# Altium project Spider Drone.PrjPcb
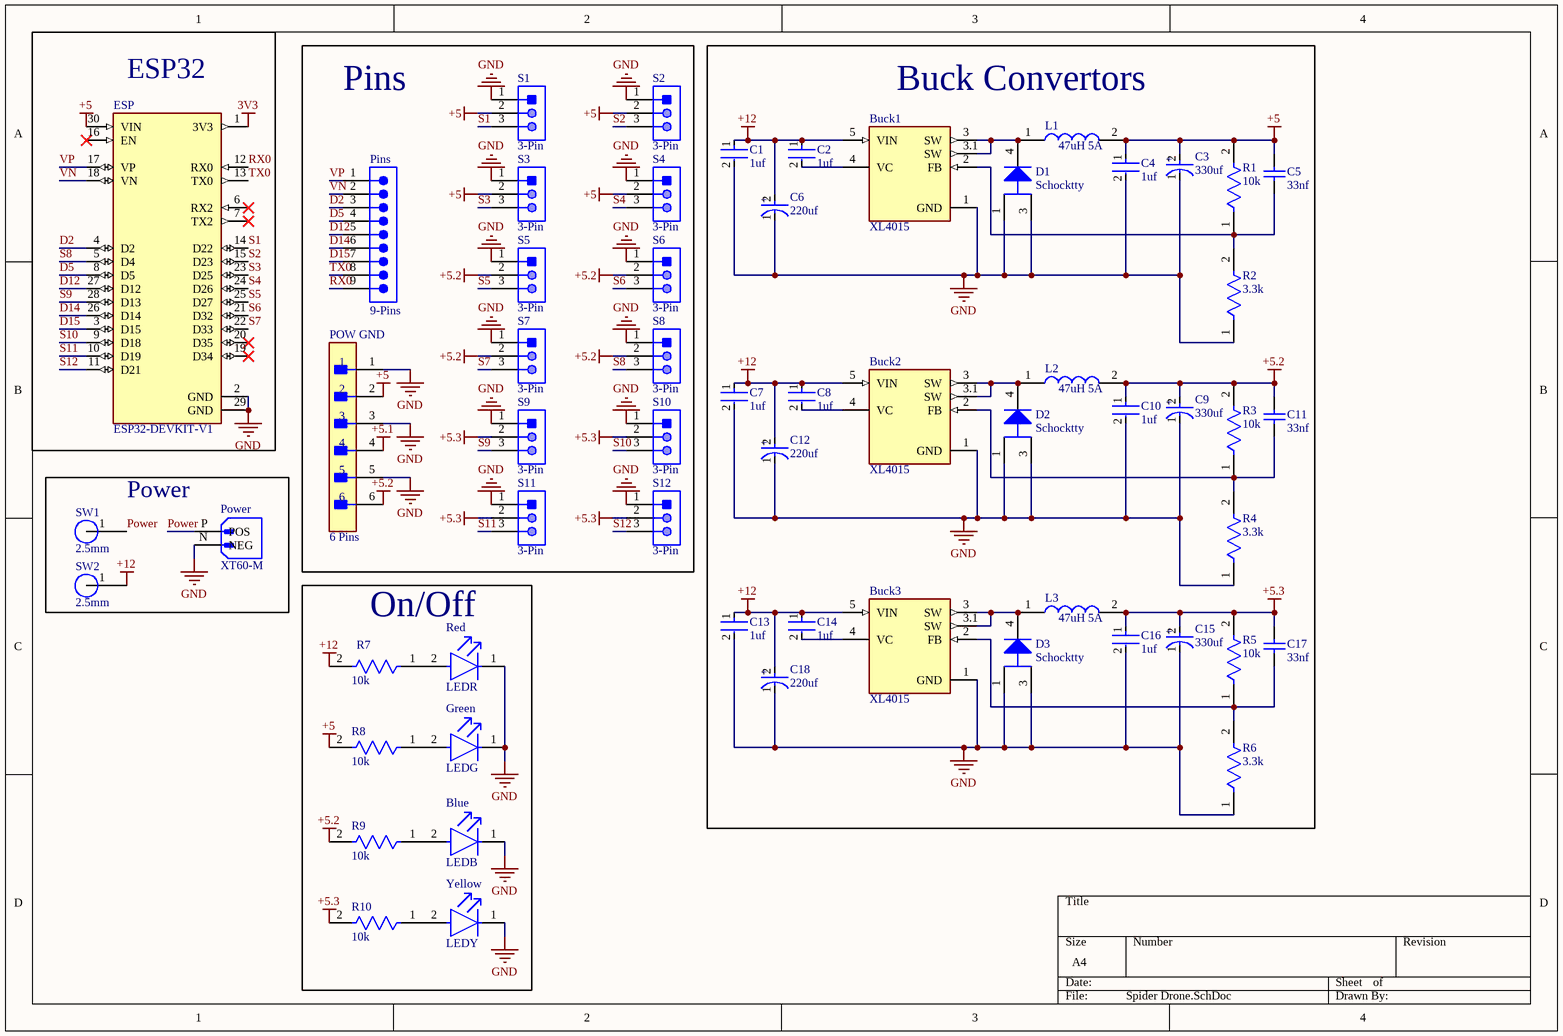
[diagram p0: Spider Drone.SchDoc]
1 sheet, 59 parts. Net scope: global (net labels, ports and power ports of the same name join across sheets).
Board file: Spider Drone.PcbDoc

## Sheet Spider Drone.SchDoc
size A4; SheetNumber: 1; SheetTotal: 1

### Parts
Blue  LEDB  [FP-APHCM2012QBC-D-F01-MFG]
Buck1  XL4015  [CONV_XL4015]
Buck2  XL4015  [CONV_XL4015]
Buck3  XL4015  [CONV_XL4015]
C1  1uf  [FP-CC0603-DA-MFG]
C2  1uf  [FP-CC0603-DA-MFG]
C3  330uf  [FP-EEH-G12-MFG]
C4  1uf  [FP-CC0603-DA-MFG]
C5  33nf  [CAPC1608X92X38LL15T08]
C6  220uf  [FP-EEH-F-MFG]
C7  1uf  [FP-CC0603-DA-MFG]
C8  1uf  [FP-CC0603-DA-MFG]
C9  330uf  [FP-EEH-G12-MFG]
C10  1uf  [FP-CC0603-DA-MFG]
C11  33nf  [CAPC1608X92X38LL15T08]
C12  220uf  [FP-EEH-F-MFG]
C13  1uf  [FP-CC0603-DA-MFG]
C14  1uf  [FP-CC0603-DA-MFG]
C15  330uf  [FP-EEH-G12-MFG]
C16  1uf  [FP-CC0603-DA-MFG]
C17  33nf  [CAPC1608X92X38LL15T08]
C18  220uf  [FP-EEH-F-MFG]
D1  Schocktty  [ONSC-DPAK-3-369C-01_V]
D2  Schocktty  [ONSC-DPAK-3-369C-01_V]
D3  Schocktty  [ONSC-DPAK-3-369C-01_V]
ESP  ESP32-DEVKIT-V1  [MODULE_ESP32_DEVKIT_V1]
Green  LEDG  [FP-APHD1608LZGCK-MFG]
L1  47uH 5A  [PM4343473NLT]
L2  47uH 5A  [PM4343473NLT]
L3  47uH 5A  [PM4343473NLT]
Pins  9-Pins  [61300911121]
POW_GND  6 Pins  [FP-22-28-4063-MFG]
Power  XT60-M  [AMASS_XT60-M]
R1  10k  [FP-CRGCQ0603-IPC_C]
R2  3.3k  [FP-AC0603-IPC_C]
R3  10k  [FP-CRGCQ0603-IPC_C]
R4  3.3k  [FP-AC0603-IPC_C]
R5  10k  [FP-CRGCQ0603-IPC_C]
R6  3.3k  [FP-AC0603-IPC_C]
R7  10k  [FP-CRGCQ0603-IPC_C]
R8  10k  [FP-CRGCQ0603-IPC_C]
R9  10k  [FP-CRGCQ0603-IPC_C]
R10  10k  [FP-CRGCQ0603-IPC_C]
Red  LEDR  [FP-LTST-C191KRKT-MFG]
S1  3-Pin  [MOLX-22-28-4033_V]
S2  3-Pin  [MOLX-22-28-4033_V]
S3  3-Pin  [MOLX-22-28-4033_V]
S4  3-Pin  [MOLX-22-28-4033_V]
S5  3-Pin  [MOLX-22-28-4033_V]
S6  3-Pin  [MOLX-22-28-4033_V]
S7  3-Pin  [MOLX-22-28-4033_V]
S8  3-Pin  [MOLX-22-28-4033_V]
S9  3-Pin  [MOLX-22-28-4033_V]
S10  3-Pin  [MOLX-22-28-4033_V]
S11  3-Pin  [MOLX-22-28-4033_V]
S12  3-Pin  [MOLX-22-28-4033_V]
SW1  2.5mm  [PCBComponent_1]
SW2  2.5mm  [PCBComponent_1]
Yellow  LEDY  [FP-SML-D12-MFG]

### Blocks framed on the sheet
ESP32: ESP
Pins: Pins POW_GND S1-S12
Buck Convertors: Buck1-Buck3 C1-C18 D1-D3 L1-L3 R1-R6
Power: Power SW1 SW2
On/Off: Blue Green R7-R10 Red Yellow

### Nets
3V3: ESP.1(3V3)
+5: C3.2(A) C4.1 C5.2 ESP.30(VIN) L1.2 POW_GND.2 R1.2 R8.2 S1.2 S2.2 S3.2 S4.2
+5.1: POW_GND.4
+5.2: C9.2(A) C10.1 C11.2 L2.2 POW_GND.6 R3.2 R9.2 S5.2 S6.2 S7.2 S8.2
+5.3: C15.2(A) C16.1 C17.2 L3.2 R5.2 R10.2 S9.2 S10.2 S11.2 S12.2
+12: Buck1.5(VIN) Buck2.5(VIN) Buck3.5(VIN) C1.1 C2.1 C6.2(A) C7.1 C8.1 C12.2(A) C13.1 C14.1 C18.2(A) R7.2 SW2.1
GND: Blue.1(C) Buck1.1(GND) Buck2.1(GND) Buck3.1(GND) C1.2 C3.1(C) C4.2 C6.1(C) C7.2 C9.1(C) C10.2 C12.1(C) C13.2 C15.1(C) C16.2 C18.1(C) D1.1(A) D1.3(A) D2.1(A) D2.3(A) D3.1(A) D3.3(A) ESP.2(GND) ESP.29(GND) Green.1(C) POW_GND.1 POW_GND.3 POW_GND.5 Power.N(NEG) R2.1 R4.1 R6.1 Red.1(C) S1.1 S2.1 S3.1 S4.1 S5.1 S6.1 S7.1 S8.1 S9.1 S10.1 S11.1 S12.1 Yellow.1(C)
D2: ESP.4(D2) Pins.3
D5: ESP.8(D5) Pins.4
D12: ESP.27(D12) Pins.5
D14: ESP.26(D14) Pins.6
D15: ESP.3(D15) Pins.7
Power: Power.P(POS) SW1.1
RX0: ESP.12(RX0) Pins.9
S1: ESP.14(D22) S1.3
S2: ESP.15(D23) S2.3
S3: ESP.23(D25) S3.3
S4: ESP.24(D26) S4.3
S5: ESP.25(D27) S5.3
S6: ESP.21(D32) S6.3
S7: ESP.22(D33) S7.3
S8: ESP.5(D4) S8.3
S9: ESP.28(D13) S9.3
S10: ESP.9(D18) S10.3
S11: ESP.10(D19) S11.3
S12: ESP.11(D21) S12.3
TX0: ESP.13(TX0) Pins.8
VN: ESP.18(VN) Pins.2
VP: ESP.17(VP) Pins.1
NetBlue_2: Blue.2(A) R9.1
NetBuck1_2: Buck1.2(FB) C5.1 R1.1 R2.2
NetBuck1_3: Buck1.3(SW) Buck1.3.1(SW) D1.4(K) L1.1
NetBuck1_4: Buck1.4(VC) C2.2
NetBuck2_2: Buck2.2(FB) C11.1 R3.1 R4.2
NetBuck2_3: Buck2.3(SW) Buck2.3.1(SW) D2.4(K) L2.1
NetBuck2_4: Buck2.4(VC) C8.2
NetBuck3_2: Buck3.2(FB) C17.1 R5.1 R6.2
NetBuck3_3: Buck3.3(SW) Buck3.3.1(SW) D3.4(K) L3.1
NetBuck3_4: Buck3.4(VC) C14.2
NetGreen_2: Green.2(A) R8.1
NetR7_1: R7.1 Red.2(A)
NetR10_1: R10.1 Yellow.2(A)

Not connected (* = marked no-connect by the designer): ESP 6(RX2)* 7(TX2)* 16(EN)* 19(D34)* 20(D35)*

### Notes on the sheet
- (in symbol CMP-05428-000257-1) +
- (in symbol CMP-05428-000570-1) +

### Library data of the parts
Blue = CMP-44529-000061-1: LED BLUE CLEAR CHIP SMD; Forward Current: 20mA; Viewing Angle: 110°; Dominant Wavelength: 465nm; Luminous Intensity: 100mcd; Number of LEDs: 1; Forward Voltage: 3.3V; Lens Color: Colorless; Packaging: Tape and Reel; Color: Blue; Length: 2mm; Case Code (Metric): 2012; Case Code (Imperial): 0805; Illumination Color: Blue; Width: 1.25mm; Mount: Surface Mount; Series: -; Height: 0.4mm; Case/Package: 0805; Package Quantity: 2000; Test Current: 20mA; Lead Free: Lead Free; Number of Pins: 2; Min Operating Temperature: -40°C; Lens Transparency: Clear; Lens Style: Clear; RoHS Compliant: Yes; Max Operating Temperature: 85°C
Buck1-Buck3 = CMP-012-00003-3: 5A 180KHz 36V Buck DC to DC Converter; MF: XLSEMI; Check_prices: https://www.snapeda.com/parts/XL4015/XLSEMI/view-part/?ref=eda; Design Item ID: XL4015; MP: XL4015; Component Type: Standard; SnapEDA_Link: https://www.snapeda.com/parts/XL4015/XLSEMI/view-part/?ref=snap; Value: *; Pins: 6; Source: XL4015.SchLib; Case/Package: None
C1 C2 C4 C7 C8 C10 C13 C14 C16 = CMP-03422-000924-1: CAP CER 1UF 16V X7R 0603; Manufacturer: YAGEO; Manufacturer Part Number: CC0603KRX7R7BB105; Tolerance: 0.1; Temperature Coefficient: 15%; Material: Ceramic; Package: CC0603-DA; RoHS: TRUE; Device Class L2: Capacitors; Temperature Characteristic: X7R; Temperature: -55°C to +125°C; Temperature Range Low: -55°C; Automotive: No; ComponentLink2Description: Datasheet; Value: 1 uF; Lead Free: Yes; Capacitance: 1 uF; ComponentLink2URL: http://www.yageo.com/documents/recent/UPY-GPHC_X7R_6.3V-to-50V_18.pdf; Device Class L1: Passive Components; Voltage: 16 V; Octopart: https://octopart.com/cc0603krx7r7bb105-yageo-42271928; Category: Cap; Digikey Description: CAP CER 1UF 16V X7R 0603; Footprint Url: http://www.yageo.com/exep/pages/download/literatures/UPY-C_GEN_24.pdf; Height: 0.9mm; Voltage Rating: 16 V; Temperature Range High: +125°C; Mouser Description: Multilayer Ceramic Capacitor, CC Series, 1 - F, - 10%, X7R, 16 V, 0603 [1608 Metric]; Device Class L3: Ceramic Capacitors
C3 C9 C15 = CMP-05428-000257-1: Aluminum Hybrid Polymer Capacitors 330uF 20% 35V Life 4000Hours AEC-Q200 RADIAL SMT
C5 C11 C17 = CMP-2006-01351-1: Manufacturer: Vitramon; Part Number: VJ0603Y333JXAAC
C6 C12 C18 = CMP-05428-000570-1: Conductive Polymer Hybrid Aluminum Electrolytic Capacitors 220uF ±20% 25V RADIAL SMT 8x10.2mm; RoHS Compliant: Yes
D1-D3 = CMP-1055-00175-1: SWITCHMODE(TM) Schottky Power Rectifier, 3-Pin DPAK, Pb-Free, Tape and Reel; PartNumber: MBRD1045T4G; Manufacturer: On Semiconductor; IFSM Max (A): 70; Configuration: Single; RoHS: TRUE; ComponentLink1Description: Manufacturer URL; PackageDescription: 3-Pin Flange Mount, Body 6.54 x 6.095 mm, Pitch 2.29 mm; Mounting Technology: Surface Mount; ComponentLink2URL: http://www.onsemi.cn/pub_link/Collateral/MBRB1045-D.PDF; PackageReference: DPAK-3-369C-01; Packing: Tape and Reel; ComponentLink3Description: Package Specification; ComponentLink3URL: http://www.onsemi.cn/pub_link/Collateral/369C.PDF; ComponentLink2Description: Datasheet; DatasheetVersion: Rev. 8; PackageVersion: Rev. E, 02/2014; ComponentLink1URL: http://www.onsemi.com/
ESP = CMP-003-000000-1: Dual core, Wi-Fi: 2.4 GHz up to 150 Mbits/s,BLE (Bluetooth Low Energy) and legacy Bluetooth, 32 bits, Up to 240 MHz; MF: Do it; Design Item ID: ESP32-DEVKIT-V1; MP: ESP32-DEVKIT-V1; Check_prices: https://www.snapeda.com/parts/ESP32-DEVKIT-V1/Do+it/view-part/?ref=eda; SnapEDA_Link: https://www.snapeda.com/parts/ESP32-DEVKIT-V1/Do+it/view-part/?ref=snap; Source: ESP32-DEVKIT-V1.SchLib; Pin Count: 30; Value: *; Package: None; Component Type: Standard
Green = CMP-44529-000045-1: LED GREEN CLEAR 1608 SMD; Test Current: 2mA; Dominant Wavelength: 525nm; Lens Color: Colorless; Luminous Intensity: 180mcd; Viewing Angle: 100°; Forward Voltage: 2.65V; Lens Size: 0.7mm; Lens Style: Round; Mount: Surface Mount; Packaging: Tape and Reel; Lens Transparency: Clear; Height: 0.75mm; Case/Package: 0603; Length: 1.6mm; Case Code (Metric): 1608; Width: 0.8mm; Color: Green; Case Code (Imperial): 0603
L1-L3 = PM4343.473NLT: Inductor; Manufacturer_Name: YAGEO; Datasheet Link: https://www.mouser.be/datasheet/2/336/P770-1663929.pdf; Height: 6.5mm; Manufacturer_Part_Number: PM4343.473NLT; Mouser Part Number: 673-PM4343.473NLT; Mouser Price/Stock: https://www.mouser.co.uk/ProductDetail/Pulse-Electronics/PM4343.473NLT?qs=l7cgNqFNU1hovlJ%252B%252BWd9Xw%3D%3D; Arrow Part Number: PM4343.473NLT; Arrow Price/Stock: https://www.arrow.com/en/products/pm4343.473nlt/pulse-electronics-corporation?region=nac
Pins = CMP-1502-01080-4: THT Vertical Pin Header WR-PHD, Pitch 2.54 mm, Single Row, 9 pins; Pitch: 2.54mm; Connector Type: Male Pin; Current Rating: 3A; Number of Positions: 9; Operating Supply Voltage: 250V; Gender: Male; Contact Resistance: 20mΩ; Color: Black; Packaging: Bulk; Number of Pins: 9; Contact Plating: Gold; Contact Material: Copper; RoHS: Compliant; Contact Mating Length: 5.9944mm; Termination: Solder; Lead Pitch: 2.54mm; Orientation: Vertical; Number of Contacts: 9; Number of Rows: 1; Mount: Through Hole
POW_GND = CMP-04776-000885-1: CONN HEADER VERT 6POS 2.54MM; Number of Circuits: 6; Voltage Rating (DC): 250V; Connector Type: Male Pin; Contact Resistance: 20mR; Glow Wire Compliant: Non-compliant; Gender: Male; Current Rating: 4A; Max Voltage Rating (DC): 250.25kV; Series: KK® 42375; Termination: Solder; Orientation: Straight; Max Operating Temperature: 75°C; Min Operating Temperature: 0°C; Mount: Through Hole; Depth: 2.49mm; Contact Material: Brass; Number of Positions: 6; Contact Mating Length: 0.24inch; Number of Rows: 1; Housing Color: Black; Max Voltage Rating (AC): 250V; Housing Material: Thermoplastic; Packaging: Bulk; Contact Plating: Gold; Contact Type: Male Pin; Package Quantity: 1; Number of Contacts: 6; Voltage Rating: 250V; Lead Free: Lead Free; RoHS Compliant: Yes; Pitch: 2.54mm; Color: Black; Flammability Rating: UL94 V-0; Radiation Hardening: No
Power = CMP-00028-00007-1: Plug; DC supply; XT60; male; PIN: 2; for cable; soldered; 30A; 500V; MF: AMASS; Value: *; Source: XT60-M.SchLib; Design Item ID: XT60-M; MP: XT60-M; Pins: 2; Check_prices: https://www.snapeda.com/parts/XT60-M/AMASS/view-part/?ref=eda; Case/Package: Package; Component Type: Standard; SnapEDA_Link: https://www.snapeda.com/parts/XT60-M/AMASS/view-part/?ref=snap
R1 R3 R5 R7-R10 = CMP-03211-009884-1: CRGCQ 0603 10K 5%; Manufacturer Part Number: CRGCQ0603J10K; Manufacturer: TE Connectivity; Tolerance: 0.05; Power Rating: 0.1W; Resistance: 10KΩ; Voltage Rating: 75V; Value: 10KΩ; Temperature Coefficient: ±100ppm/°C; Composition: Thick Film; ComponentLink2URL: https://www.te.com/commerce/DocumentDelivery/DDEController?Action=showdoc&DocId=Data+Sheet%7F1773204-3%7F1%7Fpdf%7FEnglish%7FENG_DS_1773204-3_1.pdf%7F4-2176339-923; Device Class L1: Passive Components; Package: CRGCQ0603; Mouser Description: Res Thick Film 0603 10K Ohm 5% 0.1W(1/10W) ±100ppm/C Pad SMD Automotive T/R; Temperature Range High: +155°C; Category: Res; Device Class L2: Resistors; Height: 0.55mm; RoHS: TRUE; Lead Free: Yes; Ipc Land Pattern Name: RESC16080X45; Temperature: -55°C to +155°C; Series: CRGCQ; Digikey Description: CRGCQ 0603 10K 5%; Octopart: https://octopart.com/crgcq0603j10k-te+connectivity-91018097; Device Class L3: Chip SMD Resistors; Ambient Temperature Range High: +70°C; ComponentLink2Description: Datasheet; Temperature Range Low: -55°C
R2 R4 R6 = CMP-03412-041670-1: RES 3.3kΩ 1.00% 0.2W 0603; RoHS Compliant: Yes
Red = CMP-2000-05199-2: NexarPartId: 549908; Illumination Color: Red; Lens Transparency: Clear; Luminous Intensity: 54mcd; Current: 2A; Forward Current: 20mA; Number of Elements: 1; Power Rating: 75mW; Lens Color: Colorless; Wavelength: 639nm; Viewing Angle: 130°; Voltage: 2V; Dominant Wavelength: 631nm; Reverse Voltage: 5V; Height: 550µm; Length: 1.6mm; Number of Pins: 2; Packaging: Tape and Reel; Mount: Surface Mount; Case Code (Metric): 1608; Radiation Hardening: No; Case Code (Imperial): 0603; Test Current: 20mA; Number of LEDs: 1; Schedule B: 8541402000, 8541402000; Lead Free: Lead Free; Power Dissipation: 75mW; RoHS: Compliant; Forward Voltage: 2V; Lens Style: Clear; Color: Red; Max Operating Temperature: 85°C; Depth: 800µm; Width: 800µm; Min Operating Temperature: -55°C; Case/Package: 0603
S1-S12 = CMP-1676-00001-5: Male Header, Pitch 2.54 mm, 1 x 3 Position, Height 8.38 mm, Tail Length 3.18 mm, RoHS, Bulk; Manufacturer: Molex; Rows: 1; Voltage Rating: 250 V; Current Rating: 4 A; Min Operating Temperature: 0 degC; Lead Pitch: 0.1 inch; Packaging: Bulk; Contact Finish: Gold; RoHSCompliant: true; Contact Material: Brass; PackageReference: 22-28-4033; REACH SVHC: Unknown; PackageDescription: Male Header, Pitch 2.54 mm, 1 x 3 Position, Height 8.38 mm, Tail Length 3.18 mm; ComponentLink2URL: http://www.molex.com/pdm_docs/sd/022284033_sd.pdf; Height: 8.38 mm; Mounting Technology: Through Hole; ComponentLink1Description: Manufacturer URL; Length: 7.62 mm; Mount: Through Hole; DatasheetVersion: Rev. G, 01/2012; Max Operating Temperature: 75 degC; ComponentLink2Description: Datasheet; Colour: Black; Pins: 3; Contact Plating: Gold; Package Quantity: 1; ComponentLink1URL: http://www.molex.com/
SW1 SW2 = SolderPoint25
Yellow = CMP-08952-000023-1: LED YELLOW DIFFUSED 0603 SMD; Manufacturer: Rohm; Manufacturer Part Number: SML-D12Y8WT86; Forward Voltage: 2.2V; Wavelength: 590nm; Reverse Voltage: 5V; Led Orientation: Top View; Forward Current: 20mA; Description: LED Uni-Color Yellow 2-Pin Chip LED T/R; Power Dissipation: 54mW; Luminous Intensity: 63mcd; Temperature: -40°C to +85°C; Package: SML-D12; Height: 0.65mm; Lead Free: Yes; Octopart: https://octopart.com/sml-d12y8wt86-rohm-8992279; Device Class L3: unset; Category: Diode; Device Class L2: LEDs; Temperature Range Low: -40°C; Colour: Yellow; ComponentLink2URL: https://d1d2qsbl8m0m72.cloudfront.net/en/products/databook/datasheet/opto/led/chip_mono/sml-d12x8_d13x8-e.pdf; Automotive: No; Device Class L1: Optoelectronics; Digikey Description: LED YELLOW DIFFUSED 0603 SMD; Mouser Description: Standard LEDs - SMD SMD Yellow 25-160 mcd; RoHS: TRUE; Temperature Range High: +85°C; ComponentLink2Description: Datasheet